# Altium project Servo-Driver-v2.0.PrjPcb (part 5 of 20)

## Sheet Controller-Comms-Sheet-4.SchDoc
size 420 x 297 mm; SheetNumber: 15; SheetTotal: 15
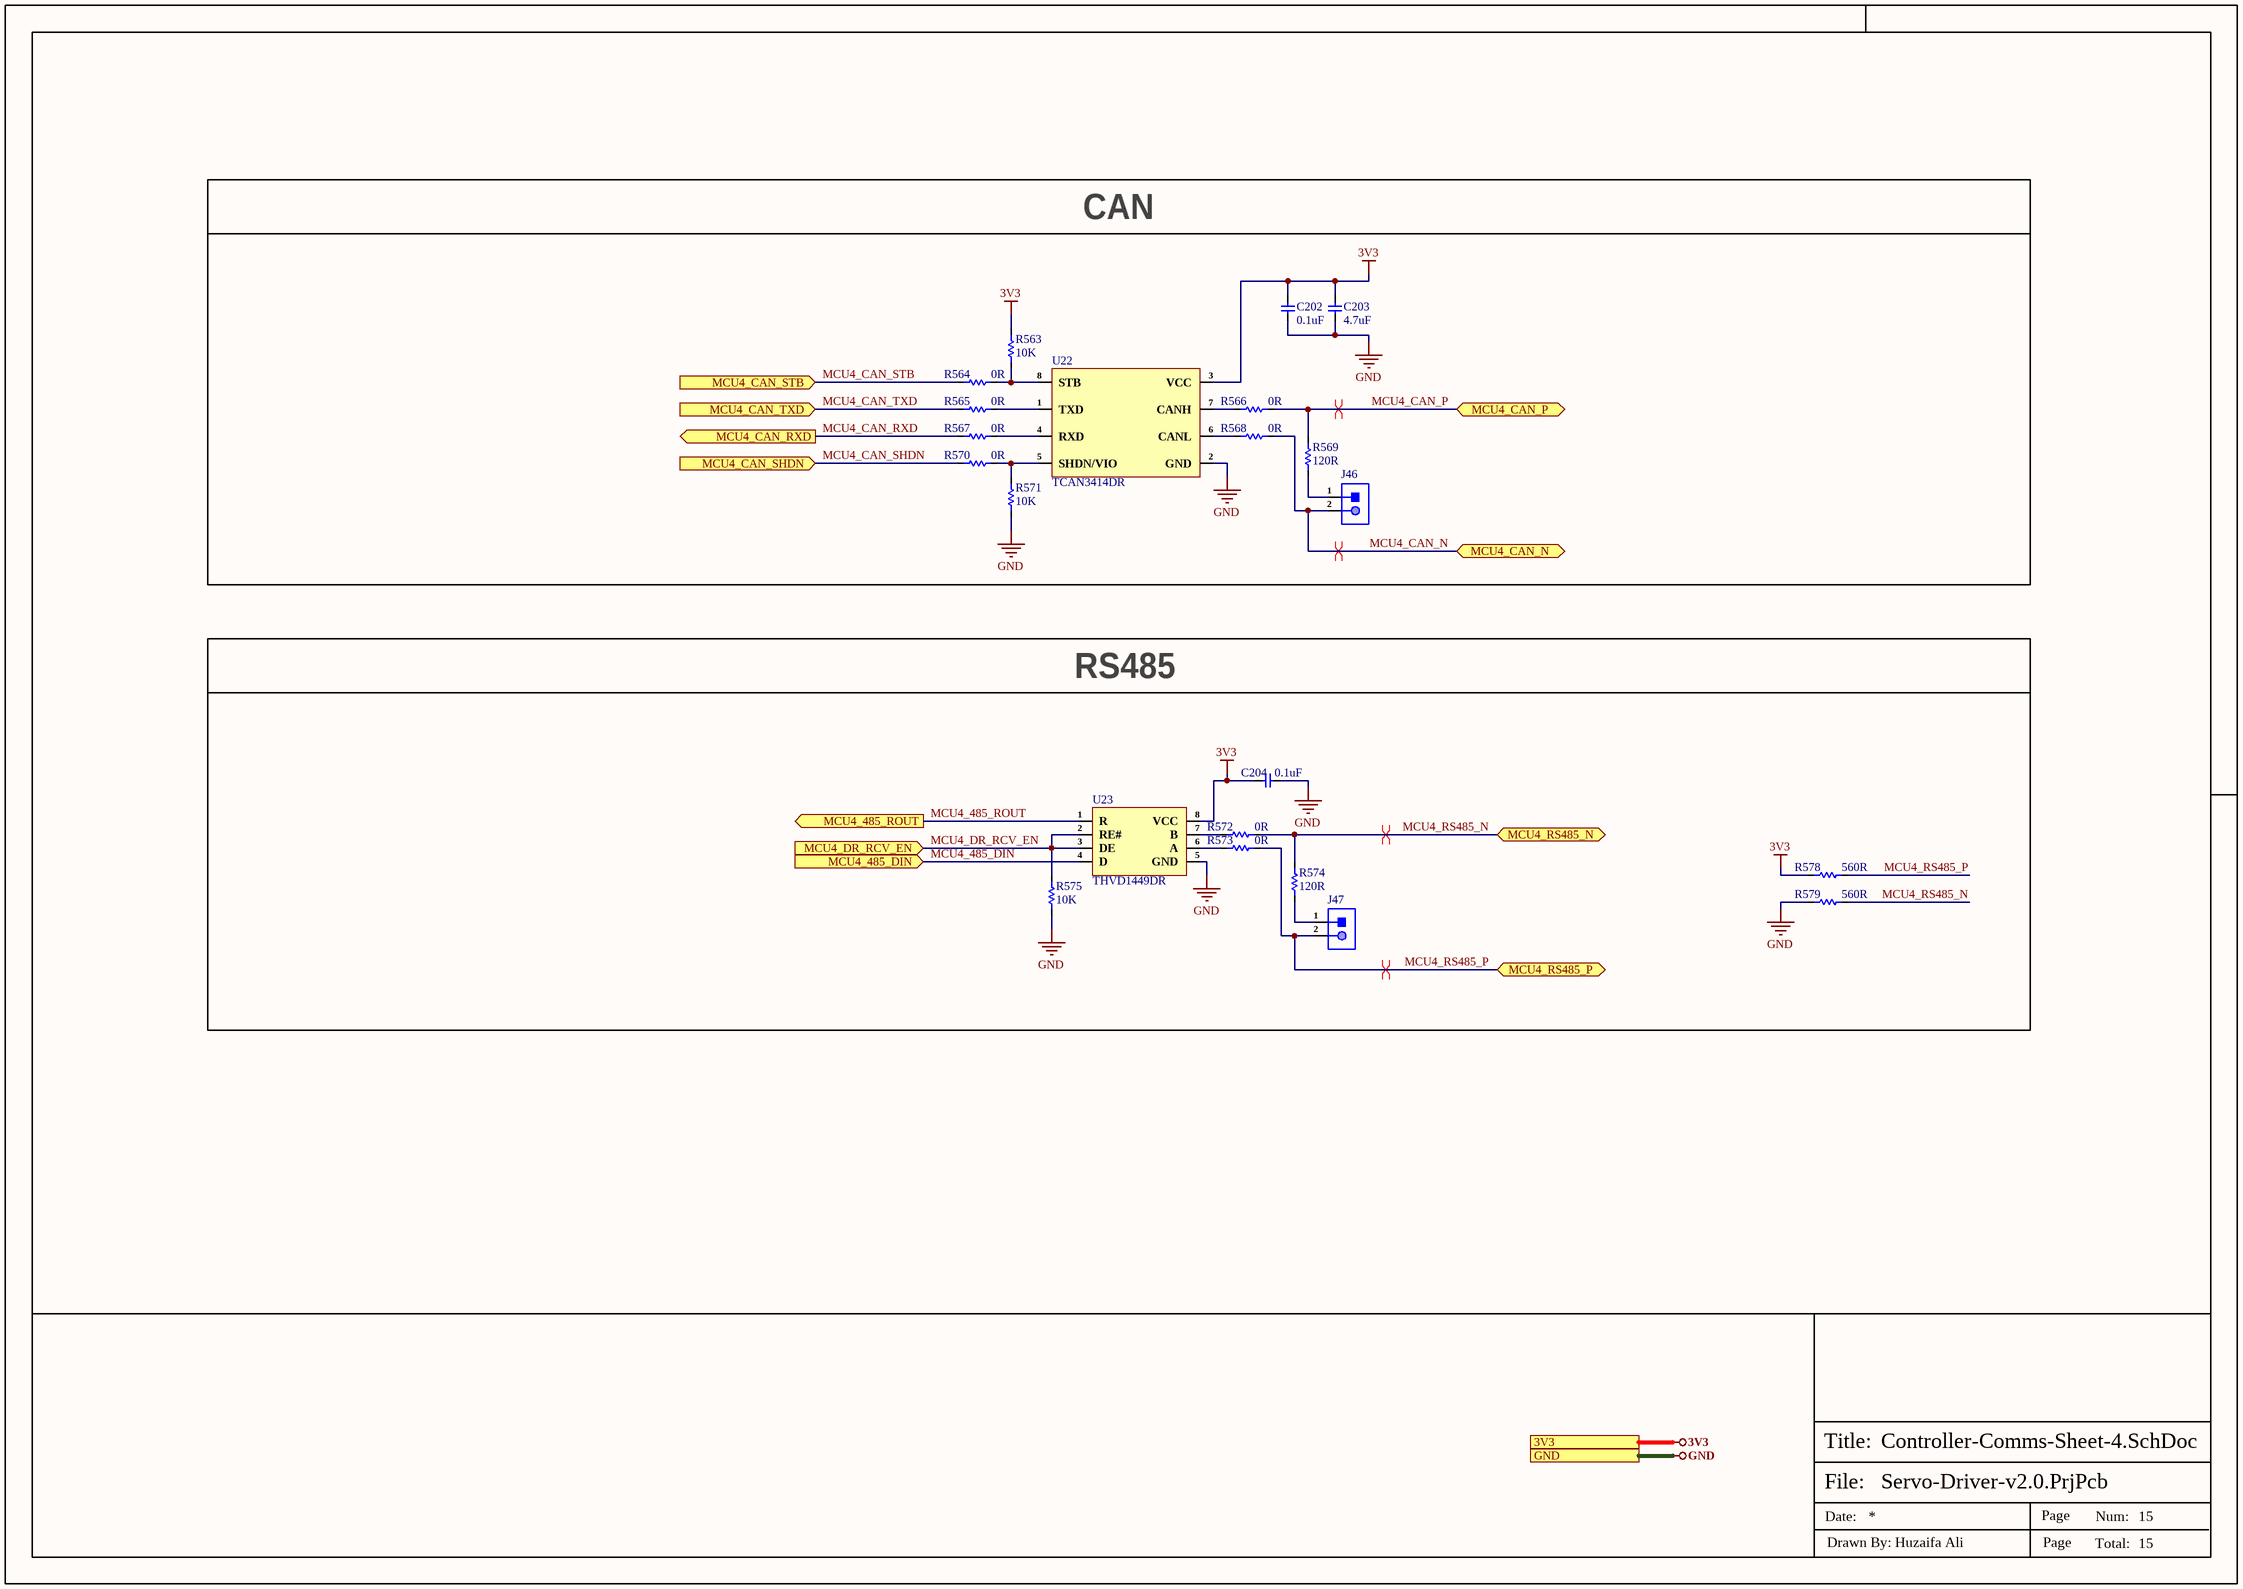
[diagram p4: Controller-Comms-Sheet-4.SchDoc]

### Parts
C202  0.1uF  [Cap-0402]
C203  4.7uF  [Cap-0402]
C204  0.1uF  [Cap-0402]
J46  X6511WV-02H-C60D30  [HDR1X2_]  (value not drawn)
J47  X6511WV-02H-C60D30  [HDR1X2_]  (value not drawn)
R563  10K  [Res-0402]
R564  0R  [Res-0402]
R565  0R  [Res-0402]
R566  0R  [Res-0402]
R567  0R  [Res-0402]
R568  0R  [Res-0402]
R569  120R  [Res-0603]
R570  0R  [Res-0402]
R571  10K  [Res-0402]
R572  0R  [Res-0402]
R573  0R  [Res-0402]
R574  120R  [Res-0603]
R575  10K  [Res-0402]
R578  560R  [Res-0402]
R579  560R  [Res-0402]
U22  TCAN3414DR  [SOIC-8(0.154", 3.90mm Width)]
U23  THVD1449DR  [SOIC-8(0.154", 3.90mm Width)]

### Blocks framed on the sheet
CAN: C202 C203 J46 R563-R571 U22
RS485: C204 J47 R572-R575 R578 R579 U23

### Ports
3V3, GND, MCU4_485_DIN (in), MCU4_485_ROUT (out), MCU4_CAN_N (bidir), MCU4_CAN_P (bidir), MCU4_CAN_RXD (out), MCU4_CAN_SHDN (in), MCU4_CAN_STB (in), MCU4_CAN_TXD (in), MCU4_DR_RCV_EN (in), MCU4_RS485_N (bidir), MCU4_RS485_P (bidir)

### Nets
3V3: C202.2 C203.2 C204.2 R563.2 R578.2 U22.3(VCC) U23.8(VCC) ; port 3V3
GND: C202.1 C203.1 C204.1 R571.1 R575.2 R579.2 U22.2(GND) U23.5(GND) ; port GND
MCU4_485_DIN: U23.4(D) ; port MCU4_485_DIN
MCU4_485_ROUT: U23.1(R) ; port MCU4_485_ROUT
MCU4_CAN_N: J46.2 R568.2 ; port MCU4_CAN_N  [project net CAN_N]
MCU4_CAN_P: R566.2 R569.2 ; port MCU4_CAN_P  [project net CAN_P]
MCU4_CAN_RXD: R567.1 ; port MCU4_CAN_RXD  [project net MCU4_CAN_RX]
MCU4_CAN_SHDN: R570.1 ; port MCU4_CAN_SHDN
MCU4_CAN_STB: R564.1 ; port MCU4_CAN_STB
MCU4_CAN_TXD: R565.1 ; port MCU4_CAN_TXD  [project net MCU4_CAN_TX]
MCU4_DR_RCV_EN: R575.1 U23.2(RE#) U23.3(DE) ; port MCU4_DR_RCV_EN
MCU4_RS485_N: R572.2 R574.2 R579.1 ; port MCU4_RS485_N  [project net MCU1_RS485_N]
MCU4_RS485_P: J47.2 R573.2 R578.1 ; port MCU4_RS485_P  [project net MCU1_RS485_P]
NetJ46_1: J46.1 R569.1
NetJ47_1: J47.1 R574.1
NetR563_1: R563.1 R564.2 U22.8(STB)
NetR565_2: R565.2 U22.1(TXD)
NetR566_1: R566.1 U22.7(CANH)
NetR567_2: R567.2 U22.4(RXD)
NetR568_1: R568.1 U22.6(CANL)
NetR570_2: R570.2 R571.2 U22.5(SHDN/VIO)
NetR572_1: R572.1 U23.7(B)
NetR573_1: R573.1 U23.6(A)

### Layout directives
differential pair; differential pair class DIFF_RS485: MCU1_RS485_N, MCU1_RS485_P
differential pair; differential pair class DIFF_CAN: CAN_N, CAN_P

### Notes on the sheet
- File:
- Title:
- Date:
- Page
- Num:
- Total:
- Drawn By: Huzaifa Ali

### Library data of the parts
C202 C204 = CC0402JRX7R7BB104: as C195 on sheet MOSFET-Motor-Sheet-4; Supplier: Digikey; Supplier Part Number: 311-1676-1-ND; Manufacturer Part Number: CC0402JRX7R7BB104; RoHS: Yes; Category: Ceramic Capacitors; Stock: 1659111; Pricing: 1=0.1, 10=0.046, 50=0.0262, 100=0.0203, 500=0.01528, 1000=0.012, 2500=0.01091, 5000=0.01004 (USD); Mounting Technology: Surface Mount; Case/Package: 0402; Case Code (Metric): 1005; Case Code (Imperial): 0402; Min Operating Temperature: -55°C; Max Operating Temperature: 125°C; Dielectric: X7R; Packaging: Tape and Reel; Package Quantity: 10000; Voltage Rating (DC): 16V; Voltage Rating: 16V; Series: CC; Construction: Flat; Length: 0.039inch; Width: 0.02inch; Height: 0.5mm; Thickness: 0.022inch; Lead Free: Lead Free; Halogen Free: Halogen Free; RoHS Compliant: Yes; ComponentLink1URL: https://datasheet.ciiva.com/13210/upy-gphc-x7r-6-3v-to-50v-8-12304-13210152.pdf?src-supplier=Mouser; ComponentLink1Description: https://datasheet.ciiva.com/13210/upy-gphc-x7r-6-3v-to-50v-8-12304-13210152.pdf?src-supplier=Mouser; LCSC Part Number: C541464
C203 = CC0402KRX5R6BB475: CAP CER 4.7UF 10V X5R 0402; Manufacturer: Yageo; Tolerance: 10%; Supplier 1: Farnell; Manufacturer Part Number: CC0402KRX5R6BB475; RoHS: Yes; Category: Ceramic Capacitors; Stock 1: 20000; Pricing 1: 10000=0.02310, 50000=0.02100 (GBP); Mount: Surface Mount; Case/Package: 0402; Case Code (Imperial): 0402; Case Code (Metric): 1005; Min Operating Temperature: -55°C; Max Operating Temperature: 85°C; Packaging: Cut Tape; Capacitance: 4.7uF; Voltage Rating: 10V; RoHS Compliant: Yes; ComponentLink1URL: http://www.yageo.com/documents/recent/UPY-GPHC_X5R_4V-to-50V_25.pdf?src-supplier=Digi-Key; ComponentLink1Description: http://www.yageo.com/documents/recent/UPY-GPHC_X5R_4V-to-50V_25.pdf?src-supplier=Digi-Key; Supplier Part Number 1: 3871698; LCSC Part Number: C326586
J46 J47 = X6511WV-02H-C60D30: as J43 on sheet MOSFET-Motor-Sheet-4; Manufacturer Part Number: X6511WV-02H-C60D30; Package: Plugin,P=2.54mm; LCSC Part Number: C706874; ComponentLink1Description: LCSC; ComponentLink1URL: https://www.lcsc.com/product-detail/Pin-Headers_XKB-Connectivity-X6511WV-02H-C60D30_C706874.html
R563 R571 R575 = RC0402FR-0710KL: as R551 on sheet MOSFET-Motor-Sheet-4; Supplier 1: Mouser; Manufacturer Part Number: RC0402FR-0710KL; RoHS: Yes; Category: Chip SMD Resistors; Stock 1: 18648329; Pricing 1: 1=0.10000, 10=0.01400, 50=0.01400, 100=0.00500, 1000=0.00300, 10000=0.00200 (USD); Case/Package: 0402; Number of Pins: 2; Case Code (Imperial): 0402; Case Code (Metric): 1005; Min Operating Temperature: -55°C; Max Operating Temperature: 155°C; Resistor Type: Thick Film; Tolerance: 1%; Packaging: Tape and Reel; Voltage Rating: 50V; Termination: SMD/SMT; Working Voltage: 50V; Number of Terminations: 2; Features: Moisture Resistant; Series: RC; Resistance Tolerance: 1%; Construction: Rectangular; Length: 1mm; Width: 0.5mm; Height: 0.32mm; Depth: 0.5mm; Lead Pitch: 0.2mm; REACH SVHC: No SVHC; Lead Free: Lead Free; RoHS Compliant: Yes; Military Standard: Not; ComponentLink1URL: https://datasheet.ciiva.com/7660/38568-7660787.pdf?src-supplier=Element14; ComponentLink1Description: https://datasheet.ciiva.com/7660/38568-7660787.pdf?src-supplier=Element14; ComponentLink2URL: https://datasheet.ciiva.com/7849/1686128-7849814.pdf?src-supplier=Element14; ComponentLink2Description: https://datasheet.ciiva.com/7849/1686128-7849814.pdf?src-supplier=Element14; ComponentLink3URL: https://datasheet.ciiva.com/7983/1018594-7983486.pdf?src-supplier=Element14; ComponentLink3Description: https://datasheet.ciiva.com/7983/1018594-7983486.pdf?src-supplier=Element14; ComponentLink4URL: https://datasheet.ciiva.com/22747/1018594-22747512.pdf?src-supplier=Element14; ComponentLink4Description: https://datasheet.ciiva.com/22747/1018594-22747512.pdf?src-supplier=Element14; ComponentLink5URL: https://datasheet.ciiva.com/12667/pyu-rc0402-51-rohs-l-6-r-12667067.pdf?src-supplier=Mouser; ComponentLink5Description: https://datasheet.ciiva.com/12667/pyu-rc0402-51-rohs-l-6-r-12667067.pdf?src-supplier=Mouser; ComponentLink6URL: https://datasheet.ciiva.com/7849/1784430-7849813.pdf?src-supplier=Element14; ComponentLink6Description: https://datasheet.ciiva.com/7849/1784430-7849813.pdf?src-supplier=Element14; ComponentLink7URL: https://datasheet.ciiva.com/7849/1784430-7849815.pdf?src-supplier=Element14; ComponentLink7Description: https://datasheet.ciiva.com/7849/1784430-7849815.pdf?src-supplier=Element14; Supplier Part Number 1: 603-RC0402FR-0710KL; LCSC Part Number: C60490
R564-R568 R570 R572 R573 = RC0402FR-070RL: as R548 on sheet MOSFET-Motor-Sheet-4; Supplier 1: Mouser; Manufacturer Part Number: RC0402FR-070RL; RoHS: Yes; Stock 1: 8556842; Pricing 1: 1=0.10000, 10=0.01400, 50=0.01400, 100=0.00600, 1000=0.00300, 5000=0.00200, 10000=0.00100 (USD); Mount: Surface Mount; Case/Package: 0402; Contact Plating: Tin,Matte; Case Code (Imperial): 0402; Case Code (Metric): 1005; Size Code: 0402; Min Operating Temperature: -55°C; Max Operating Temperature: 155°C; Resistance: 0R; Resistor Type: Thick Film; Packaging: Tape and Reel; Termination: SMD/SMT; Features: Moisture Resistant; Series: RC; Number of Terminations: 2; Length: 1mm; Width: 0.5mm; Height: 0.35mm; Radiation Hardening: No; Lead Free: Lead Free; RoHS Compliant: Yes; ComponentLink1URL: https://datasheet.ciiva.com/8896/pyu-rc0402-51-rohs-l-6-8896149.pdf?src-supplier=Avnet; ComponentLink1Description: https://datasheet.ciiva.com/8896/pyu-rc0402-51-rohs-l-6-8896149.pdf?src-supplier=Avnet; ComponentLink2URL: https://datasheet.ciiva.com/16790/pyu-rc0402-51-rohs-l-6-r-16790444.pdf?src-supplier=Future+Electronics; ComponentLink2Description: https://datasheet.ciiva.com/16790/pyu-rc0402-51-rohs-l-6-r-16790444.pdf?src-supplier=Future+Electronics; Supplier Part Number 1: 603-RC0402FR-070RL; LCSC Part Number: C106231
R569 R574 = RC0603FR-07120RL: as R550 on sheet MOSFET-Motor-Sheet-4; Supplier 1: Digi-Key; Manufacturer Part Number: RC0603FR-07120RL; RoHS: Yes; Category: Chip SMD Resistors; Stock 1: 839061; Pricing 1: 1=0.10000, 10=0.02400, 100=0.00970, 1000=0.00436, 2500=0.00378 (USD); Case/Package: 0603; Number of Pins: 2; Case Code (Metric): 1608; Case Code (Imperial): 0603; Size Code: 0603; Min Operating Temperature: -55°C; Max Operating Temperature: 155°C; Resistance: 120R; Tolerance: 1%; Resistor Type: Thick Film; Packaging: Tape and Reel; Voltage Rating: 50V; Package Quantity: 1; Number of Terminations: 2; Termination: SMD/SMT; Max Power Dissipation: 100mW; Features: Moisture Resistant; Series: RC; Construction: Rectangular; Resistance Tolerance: 1%; Length: 1.6mm; Width: 0.031inch; Height: 0.022inch; Depth: 0.8mm; REACH SVHC: No SVHC; Lead Free: Lead Free; Military Standard: Not; RoHS Compliant: Yes; ComponentLink1URL: https://datasheet.ciiva.com/2553/pyu-r-int-thick-7-2553512.pdf?src-supplier=Digi-Key; ComponentLink1Description: https://datasheet.ciiva.com/2553/pyu-r-int-thick-7-2553512.pdf?src-supplier=Digi-Key; ComponentLink2URL: https://datasheet.ciiva.com/7746/443971-7746248.pdf?src-supplier=Element14; ComponentLink2Description: https://datasheet.ciiva.com/7746/443971-7746248.pdf?src-supplier=Element14; ComponentLink3URL: https://datasheet.ciiva.com/2553/pyu-r-int-thick-7-2553513.pdf?src-supplier=Digi-Key; ComponentLink3Description: https://datasheet.ciiva.com/2553/pyu-r-int-thick-7-2553513.pdf?src-supplier=Digi-Key; ComponentLink4URL: https://datasheet.ciiva.com/7746/443971-7746249.pdf?src-supplier=Element14; ComponentLink4Description: https://datasheet.ciiva.com/7746/443971-7746249.pdf?src-supplier=Element14; ComponentLink5URL: https://datasheet.ciiva.com/2553/pyu-r-int-thick-7-2553514.pdf?src-supplier=Digi-Key; ComponentLink5Description: https://datasheet.ciiva.com/2553/pyu-r-int-thick-7-2553514.pdf?src-supplier=Digi-Key; ComponentLink6URL: https://datasheet.ciiva.com/46395/443971-46395021.pdf?src-supplier=Element14; ComponentLink6Description: https://datasheet.ciiva.com/46395/443971-46395021.pdf?src-supplier=Element14; Supplier Part Number 1: 311-120HRCT-ND; LCSC Part Number: C114640
R578 R579 = RC0402FR-07560RL: RES 560 OHM 1% 1/16W 0402; Manufacturer: Yageo; Power Rating: 63mW; Temperature Coefficient: 100ppm/°C; Voltage Rating: 50V; Item Type: Resistor; Supplier: Future Electronics; Supplier Part Number: 8872046; Manufacturer Part Number: RC0402FR-07560RL; RoHS: Yes; Category: Chip SMD Resistors; Stock: 1360000; Pricing: 10000=0.0012, 100000=0.0011, 300000=0.0011, 1250000=0.001, 3000000=0.0009 (USD); Case/Package: 0402; Case Code (Metric): 1005; Case Code (Imperial): 0402; Min Operating Temperature: -55°C; Max Operating Temperature: 155°C; Tolerance: 1%; Packaging: Tape and Reel; Value: 560R; Package Quantity: 1; Resistor Type: Thick Film; Number of Terminations: 2; Termination: SMD/SMT; Max Power Dissipation: 63mW; Features: Moisture Resistant; Series: RC; Construction: Rectangular; Resistance Tolerance: 1%; Length: 1mm; Width: 0.02inch; Height: 0.016inch; Depth: 0.5mm; RoHS Compliant: Yes; Military Standard: Not; Lead Free: Lead Free; Reach SVHC Compliant: Unknown; ComponentLink1URL: https://datasheet.ciiva.com/2453/pyu-r-int-thick-7-2453458.pdf?src-supplier=Digikey; ComponentLink1Description: https://datasheet.ciiva.com/2453/pyu-r-int-thick-7-2453458.pdf?src-supplier=Digikey; ComponentLink2URL: https://datasheet.ciiva.com/2453/pyu-r-int-thick-7-2453459.pdf?src-supplier=Digikey; ComponentLink2Description: https://datasheet.ciiva.com/2453/pyu-r-int-thick-7-2453459.pdf?src-supplier=Digikey; ComponentLink3URL: https://datasheet.ciiva.com/2453/pyu-r-int-thick-7-2453457.pdf?src-supplier=Digikey; ComponentLink3Description: https://datasheet.ciiva.com/2453/pyu-r-int-thick-7-2453457.pdf?src-supplier=Digikey; ComponentLink4URL: https://datasheet.ciiva.com/12558/pyu-rc0402-51-rohs-l-6-r-8721-12558383.pdf?src-supplier=Mouser; ComponentLink4Description: https://datasheet.ciiva.com/12558/pyu-rc0402-51-rohs-l-6-r-8721-12558383.pdf?src-supplier=Mouser; ComponentLink5URL: https://datasheet.ciiva.com/7850/1018594-7850042.pdf?src-supplier=Element14; ComponentLink5Description: https://datasheet.ciiva.com/7850/1018594-7850042.pdf?src-supplier=Element14; ComponentLink6URL: https://datasheet.ciiva.com/7850/1018594-7850043.pdf?src-supplier=Element14; ComponentLink6Description: https://datasheet.ciiva.com/7850/1018594-7850043.pdf?src-supplier=Element14; LCSC Part Number: C163460
U22 = TCAN3414DR: IC TRANSCEIVER HALF 1/1 8SOIC; Manufacturer: Texas Instruments; Supplier: Mouser; LCSC Part Number: C22396693; Manufacturer Part Number: TCAN3414DR; RoHS: No; Item Type: IC; Stock: 201; Pricing: 1=1.55, 10=1.1, 50=1.1, 100=0.895, 1000=0.763, 10000=0.681 (USD); Case/Package: SOIC; Pins: 8; Length: 4.9mm; Width: 3.91mm; Height: 1.75mm; Thickness: 1.58mm
U23 = THVD1449DR: as U21 on sheet MOSFET-Motor-Sheet-4; Supplier: Mouser; LCSC Part Number: C3235059; Manufacturer Part Number: THVD1449DR; RoHS: No; Item Type: IC; Stock: 7454; Pricing: 1=3.62, 10=2.51, 50=2.51, 100=2.27, 1000=2.02, 10000=1.95 (USD)

## Sheet Controller-Driver-Sheet-3.SchDoc
size 420 x 297 mm; SheetNumber: 10; SheetTotal: 15
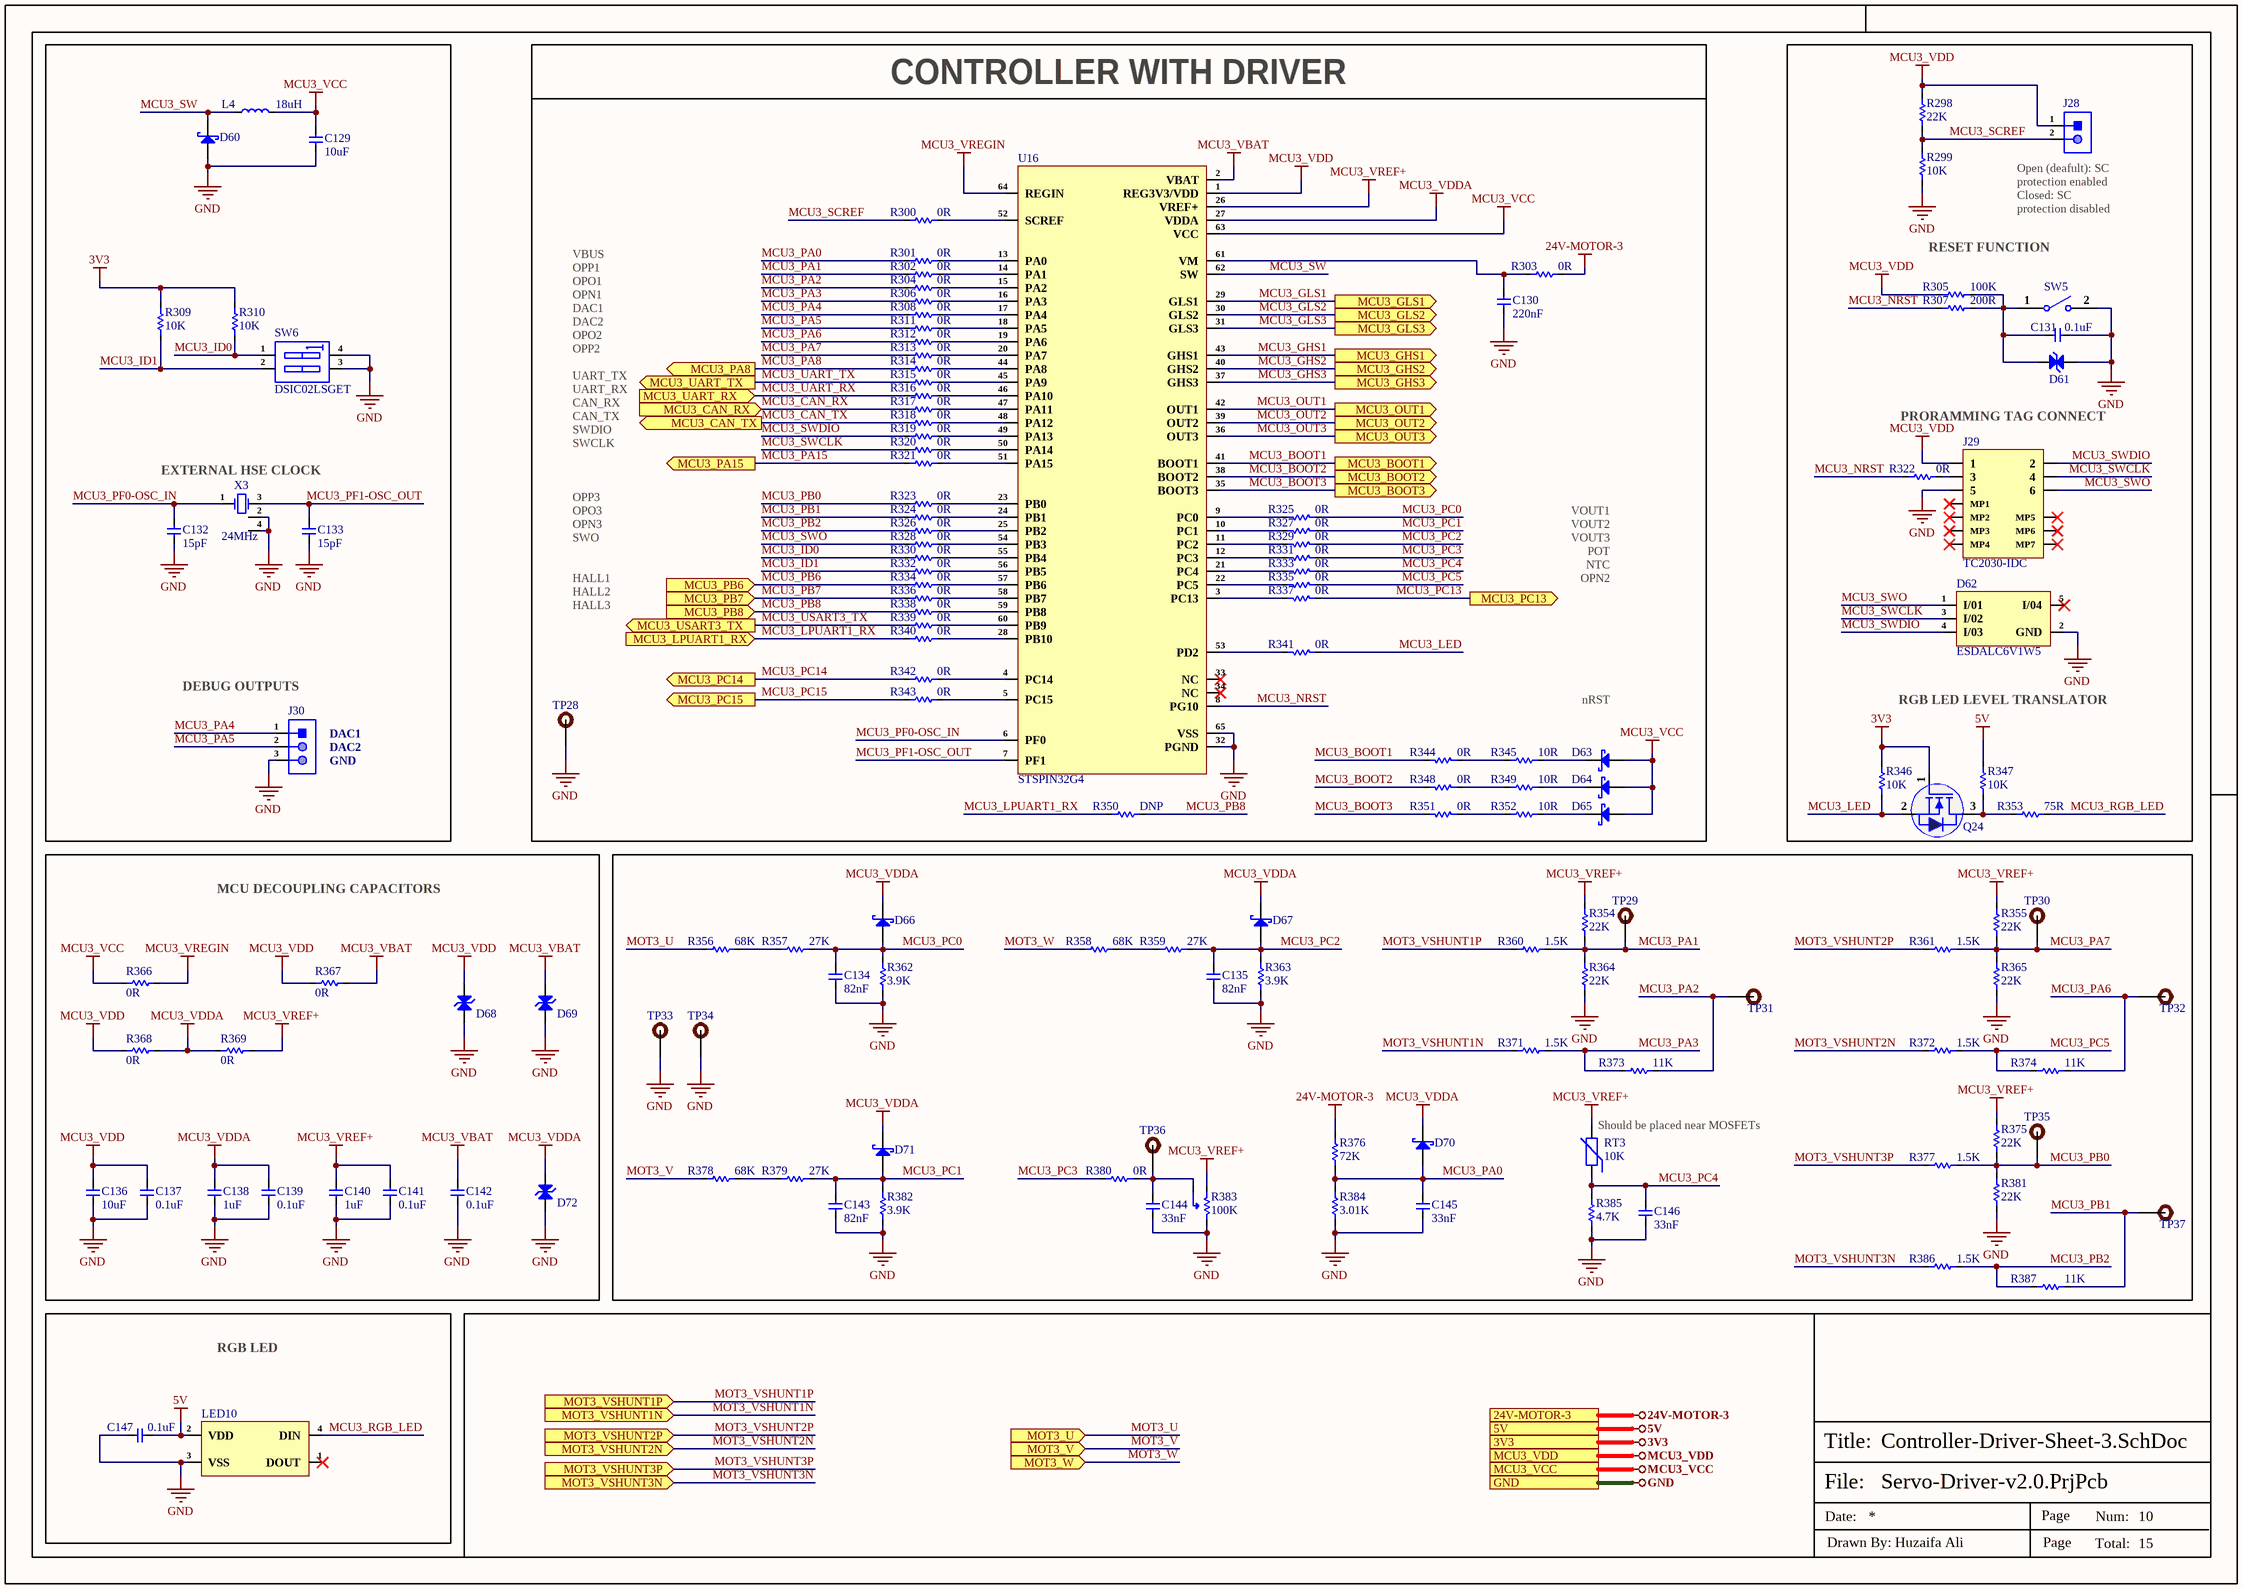
[diagram p5: Controller-Driver-Sheet-3.SchDoc]

### Parts
C129  10uF  [Cap-0805]
C130  220nF  [Cap-0805]
C131  0.1uF  [Cap-0402]
C132  15pF  [Cap-0201]
C133  15pF  [Cap-0201]
C134  82nF  [Cap-0603]
C135  82nF  [Cap-0603]
C136  10uF  [Cap-0603]
C137  0.1uF  [Cap-0402]
C138  1uF  [Cap-0402]
C139  0.1uF  [Cap-0402]
C140  1uF  [Cap-0402]
C141  0.1uF  [Cap-0402]
C142  0.1uF  [Cap-0402]
C143  82nF  [Cap-0603]
C144  33nF  [Cap-0603]
C145  33nF  [Cap-0603]
C146  33nF  [Cap-0603]
C147  0.1uF  [Cap-0402]
D60  STPS1H100A  [SMA]  (value not drawn)
D61  ESDM2033MX4T5G  [DFN-2(0.3x0.6)]  (value not drawn)
D62  ESDALC6V1W5  [SOT-323-5]
D63  BAT46ZFILM  [SOD-123]  (value not drawn)
D64  BAT46ZFILM  [SOD-123]  (value not drawn)
D65  BAT46ZFILM  [SOD-123]  (value not drawn)
D66  BAT30KFILM  [SOD-523]  (value not drawn)
D67  BAT30KFILM  [SOD-523]  (value not drawn)
D68  ESDM2033MX4T5G  [DFN-2(0.3x0.6)]  (value not drawn)
D69  ESDM2033MX4T5G  [DFN-2(0.3x0.6)]  (value not drawn)
D70  BAT30KFILM  [SOD-523]  (value not drawn)
D71  BAT30KFILM  [SOD-523]  (value not drawn)
D72  ESDM2033MX4T5G  [DFN-2(0.3x0.6)]  (value not drawn)
J28  X6511WV-02H-C60D30  [HDR1X2_]  (value not drawn)
J29  TC2030-IDC  [TC2030-IDC_]
J30  X6511WV-03H-C60D30  [HDR1X3_]  (value not drawn)
L4  18uH  [FNR5040S180MT]
LED10  WS2812D-F5  [WS2812D-F5]  (value not drawn)
Q24  Si2302CDS  [Sot-23]  (value not drawn)
R298  22K  [Res-0402]
R299  10K  [Res-0402]
R300  0R  [Res-0402]
R301  0R  [Res-0402]
R302  0R  [Res-0402]
R303  0R  [Res-0805]
R304  0R  [Res-0402]
R305  100K  [Res-0402]
R306  0R  [Res-0402]
R307  200R  [Res-0402]
R308  0R  [Res-0402]
R309  10K  [Res-0402]
R310  10K  [Res-0402]
R311  0R  [Res-0402]
R312  0R  [Res-0402]
R313  0R  [Res-0402]
R314  0R  [Res-0402]
R315  0R  [Res-0402]
R316  0R  [Res-0402]
R317  0R  [Res-0402]
R318  0R  [Res-0402]
R319  0R  [Res-0402]
R320  0R  [Res-0402]
R321  0R  [Res-0402]
R322  0R  [Res-0402]
R323  0R  [Res-0402]
R324  0R  [Res-0402]
R325  0R  [Res-0402]
R326  0R  [Res-0402]
R327  0R  [Res-0402]
R328  0R  [Res-0402]
R329  0R  [Res-0402]
R330  0R  [Res-0402]
R331  0R  [Res-0402]
R332  0R  [Res-0402]
R333  0R  [Res-0402]
R334  0R  [Res-0402]
R335  0R  [Res-0402]
R336  0R  [Res-0402]
R337  0R  [Res-0402]
R338  0R  [Res-0402]
R339  0R  [Res-0402]
R340  0R  [Res-0402]
R341  0R  [Res-0402]
R342  0R  [Res-0402]
R343  0R  [Res-0402]
R344  0R  [Res-0402]
R345  10R  [Res-0603]
R346  10K  [Res-0402]
R347  10K  [Res-0402]
R348  0R  [Res-0402]
R349  10R  [Res-0603]
R350  DNP  [Res-0402]
R351  0R  [Res-0402]
R352  10R  [Res-0603]
R353  75R  [Res-0402]
R354  22K  [Res-0402]
R355  22K  [Res-0402]
R356  68K  [Res-0603]
R357  27K  [Res-0603]
R358  68K  [Res-0603]
R359  27K  [Res-0603]
R360  1.5K  [Res-0402]
R361  1.5K  [Res-0402]
R362  3.9K  [Res-0603]
R363  3.9K  [Res-0603]
R364  22K  [Res-0402]
R365  22K  [Res-0402]
R366  0R  [Res-0805]
R367  0R  [Res-0805]
R368  0R  [Res-0805]
R369  0R  [Res-0805]
R371  1.5K  [Res-0402]
R372  1.5K  [Res-0402]
R373  11K  [Res-0402]
R374  11K  [Res-0402]
R375  22K  [Res-0402]
R376  72K  [Res-0603]
R377  1.5K  [Res-0402]
R378  68K  [Res-0603]
R379  27K  [Res-0603]
R380  0R  [Res-0805]
R381  22K  [Res-0402]
R382  3.9K  [Res-0603]
R383  100K  [3386P-1-104TLF]
R384  3.01K  [Res-0603]
R385  4.7K  [Res-0402]
R386  1.5K  [Res-0402]
R387  11K  [Res-0402]
RT3  10K  [Res-0603]
SW5  B3U-1000P  [B3U-1000P]  (value not drawn)
SW6  DSIC02LSGET  [DSIC02LSGET]
TP28  TEST POINT  [Test-point]  (value not drawn)  (no BOM)
TP29  TEST POINT  [Test-point]  (value not drawn)  (no BOM)
TP30  TEST POINT  [Test-point]  (value not drawn)  (no BOM)
TP31  TEST POINT  [Test-point]  (value not drawn)  (no BOM)
TP32  TEST POINT  [Test-point]  (value not drawn)  (no BOM)
TP33  TEST POINT  [Test-point]  (value not drawn)  (no BOM)
TP34  TEST POINT  [Test-point]  (value not drawn)  (no BOM)
TP35  TEST POINT  [Test-point]  (value not drawn)  (no BOM)
TP36  TEST POINT  [Test-point]  (value not drawn)  (no BOM)
TP37  TEST POINT  [Test-point]  (value not drawn)  (no BOM)
U16  STSPIN32G4  [64-VFQFPN 9X9]
X3  24MHz  [SMD2016-4P]

### Blocks framed on the sheet
CONTROLLER WITH DRIVER: C130 D63-D65 R300-R304 R306 R308 R311-R321 R323-R345 R348-R352 TP28 U16
MCU DECOUPLING CAPACITORS: C136-C142 D68 D69 D72 R366-R369
Should be placed near MOSFETs: C134 C135 C143-C146 D66 D67 D70 D71 R354-R365 R371-R387 RT3 TP29-TP37
RGB LED: C147 LED10

### Ports
3V3, 5V, 24V-MOTOR-3, GND, MCU3_BOOT1 (out), MCU3_BOOT2 (out), MCU3_BOOT3 (out), MCU3_CAN_RX (in), MCU3_CAN_TX (out), MCU3_GHS1 (out), MCU3_GHS2 (out), MCU3_GHS3 (out), MCU3_GLS1 (out), MCU3_GLS2 (out), MCU3_GLS3 (out), MCU3_LPUART1_RX (in), MCU3_OUT1 (out), MCU3_OUT2 (out), MCU3_OUT3 (out), MCU3_PA8 (out), MCU3_PA15 (out), MCU3_PB6 (in), MCU3_PB7 (in), MCU3_PB8 (in), MCU3_PC13 (out), MCU3_PC14 (out), MCU3_PC15 (out), MCU3_UART_RX (in), MCU3_UART_TX (out), MCU3_USART3_TX (out), MCU3_VCC, MCU3_VDD, MOT3_U (in), MOT3_V (in), MOT3_VSHUNT1N (in), MOT3_VSHUNT1P (in), MOT3_VSHUNT2N (in), MOT3_VSHUNT2P (in), MOT3_VSHUNT3N (in), MOT3_VSHUNT3P (in), MOT3_W (in)

### Nets
3V3: Q24.1(G) R309.2 R310.2 R346.2 ; port 3V3
5V: C147.2 LED10.2(VDD) R347.2 ; port 5V
24V-MOTOR-3: R303.2 R376.2 ; port 24V-MOTOR-3
GND: C129.1 C130.1 C131.1 C132.1 C133.1 C134.1 C135.1 C136.1 C137.1 C138.1 C139.1 C140.1 C141.1 C142.1 C143.1 C144.1 C145.1 C146.1 C147.1 D60.2(A) D61.1(A) D62.2(GND) D68.1(A) D69.1(A) D72.1(A) J29.5 J30.3 LED10.3(VSS) R299.1 R362.1 R363.1 R364.1 R365.1 R381.1 R382.1 R383.3(CW) R384.1 R385.1 SW5.2 SW6.3(A3) SW6.4(B3) TP28.1 TP33.1 TP34.1 U16.32(PGND) U16.65(VSS) X3.2(GND) X3.4(GND) ; port GND
MCU3_VBAT: C142.2 D69.2(A) R367.2 U16.2(VBAT)
MCU3_VCC: C129.2 D63.1(A) D64.1(A) D65.1(A) L4.2 R366.1 U16.63(VCC) ; port MCU3_VCC
MCU3_VDD: C136.2 C137.2 D68.2(A) J28.1 J29.1 R298.2 R305.1 R367.1 R368.1 U16.1(REG3V3/VDD) ; port MCU3_VDD
MCU3_VDDA: C138.2 C139.2 D66.2(K) D67.2(K) D70.2(K) D71.2(K) D72.2(A) R368.2 R369.1 U16.27(VDDA)
MCU3_VREF+: C140.2 C141.2 R354.2 R355.2 R369.2 R375.2 R383.1(CCW) RT3.2 U16.26(VREF+)
MCU3_VREGIN: R366.2 U16.64(REGIN)
MCU3_BOOT1: R344.1 U16.41(BOOT1) ; port MCU3_BOOT1
MCU3_BOOT2: R348.1 U16.38(BOOT2) ; port MCU3_BOOT2
MCU3_BOOT3: R351.1 U16.35(BOOT3) ; port MCU3_BOOT3
MCU3_CAN_RX: R317.2 ; port MCU3_CAN_RX
MCU3_CAN_TX: R318.2 ; port MCU3_CAN_TX
MCU3_GHS1: U16.43(GHS1) ; port MCU3_GHS1
MCU3_GHS2: U16.40(GHS2) ; port MCU3_GHS2
MCU3_GHS3: U16.37(GHS3) ; port MCU3_GHS3
MCU3_GLS1: U16.29(GLS1) ; port MCU3_GLS1
MCU3_GLS2: U16.30(GLS2) ; port MCU3_GLS2
MCU3_GLS3: U16.31(GLS3) ; port MCU3_GLS3
MCU3_ID0: R310.1 R330.2 SW6.1(A1)
MCU3_ID1: R309.1 R332.2 SW6.2(A2)
MCU3_LED: Q24.2(S) R341.2 R346.1
MCU3_LPUART1_RX: R340.2 R350.2 ; port MCU3_LPUART1_RX  [project net MCU3_485_ROUT]
MCU3_NRST: R307.1 R322.2 U16.8(PG10)
MCU3_OUT1: U16.42(OUT1) ; port MCU3_OUT1
MCU3_OUT2: U16.39(OUT2) ; port MCU3_OUT2
MCU3_OUT3: U16.36(OUT3) ; port MCU3_OUT3
MCU3_PA0: C145.2 D70.1(A) R301.2 R376.1 R384.2
MCU3_PA1: R302.2 R354.1 R360.2 R364.2 TP29.1
MCU3_PA2: R304.2 R373.2 TP31.1
MCU3_PA3: R306.2 R371.2 R373.1
MCU3_PA4: J30.1 R308.2
MCU3_PA5: J30.2 R311.2
MCU3_PA6: R312.2 R374.2 TP32.1
MCU3_PA7: R313.2 R355.1 R361.2 R365.2 TP30.1
MCU3_PA8: R314.2 ; port MCU3_PA8
MCU3_PA15: R321.2 ; port MCU3_PA15
MCU3_PB0: R323.2 R375.1 R377.2 R381.2 TP35.1
MCU3_PB1: R324.2 R387.2 TP37.1
MCU3_PB2: R326.2 R386.2 R387.1
MCU3_PB6: R334.2 ; port MCU3_PB6  [project net MCU3_HALL1]
MCU3_PB7: R336.2 ; port MCU3_PB7  [project net MCU3_HALL2]
MCU3_PB8: R338.2 R350.1 ; port MCU3_PB8  [project net MCU3_HALL3]
MCU3_PC0: C134.2 D66.1(A) R325.2 R357.2 R362.2
MCU3_PC1: C143.2 D71.1(A) R327.2 R379.2 R382.2
MCU3_PC2: C135.2 D67.1(A) R329.2 R359.2 R363.2
MCU3_PC3: R331.2 R380.1
MCU3_PC4: C146.2 R333.2 R385.2 RT3.1
MCU3_PC5: R335.2 R372.2 R374.1
MCU3_PC13: R337.2 ; port MCU3_PC13  [project net MCU3_DR_RCV_EN]
MCU3_PC14: R342.2 ; port MCU3_PC14  [project net MCU3_CAN_SHDN]
MCU3_PC15: R343.2 ; port MCU3_PC15  [project net MCU3_CAN_STB]
MCU3_PF0-OSC_IN: C132.2 U16.6(PF0) X3.1(OSC1)
MCU3_PF1-OSC_OUT: C133.2 U16.7(PF1) X3.3(OSC2)
MCU3_RGB_LED: LED10.4(DIN) R353.2
MCU3_SCREF: J28.2 R298.1 R299.2 R300.2
MCU3_SW: D60.1(K) L4.1 U16.62(SW)
MCU3_SWCLK: D62.3(I/02) J29.4 R320.2
MCU3_SWDIO: D62.4(I/03) J29.2 R319.2
MCU3_SWO: D62.1(I/01) J29.6 R328.2
MCU3_UART_RX: R316.2 ; port MCU3_UART_RX
MCU3_UART_TX: R315.2 ; port MCU3_UART_TX
MCU3_USART3_TX: R339.2 ; port MCU3_USART3_TX  [project net MCU3_485_DIN]
MOT3_U: R356.1 ; port MOT3_U
MOT3_V: R378.1 ; port MOT3_V
MOT3_VSHUNT1N: R371.1 ; port MOT3_VSHUNT1N
MOT3_VSHUNT1P: R360.1 ; port MOT3_VSHUNT1P
MOT3_VSHUNT2N: R372.1 ; port MOT3_VSHUNT2N
MOT3_VSHUNT2P: R361.1 ; port MOT3_VSHUNT2P
MOT3_VSHUNT3N: R386.1 ; port MOT3_VSHUNT3N
MOT3_VSHUNT3P: R377.1 ; port MOT3_VSHUNT3P
MOT3_W: R358.1 ; port MOT3_W
NetC130_2: C130.2 R303.1 U16.61(VM)
NetC131_2: C131.2 D61.2(A) R305.2 R307.2 SW5.1
NetC144_2: C144.2 R380.2 R383.2(Wiper) TP36.1
NetD63_2: D63.2(K) R345.2
NetD64_2: D64.2(K) R349.2
NetD65_2: D65.2(K) R352.2
NetJ29_3: J29.3 R322.1
NetQ24_3: Q24.3(D) R347.1 R353.1
NetR300_1: R300.1 U16.52(SCREF)
NetR301_1: R301.1 U16.13(PA0)
NetR302_1: R302.1 U16.14(PA1)
NetR304_1: R304.1 U16.15(PA2)
NetR306_1: R306.1 U16.16(PA3)
NetR308_1: R308.1 U16.17(PA4)
NetR311_1: R311.1 U16.18(PA5)
NetR312_1: R312.1 U16.19(PA6)
NetR313_1: R313.1 U16.20(PA7)
NetR314_1: R314.1 U16.44(PA8)
NetR315_1: R315.1 U16.45(PA9)
NetR316_1: R316.1 U16.46(PA10)
NetR317_1: R317.1 U16.47(PA11)
NetR318_1: R318.1 U16.48(PA12)
NetR319_1: R319.1 U16.49(PA13)
NetR320_1: R320.1 U16.50(PA14)
NetR321_1: R321.1 U16.51(PA15)
NetR323_1: R323.1 U16.23(PB0)
NetR324_1: R324.1 U16.24(PB1)
NetR325_1: R325.1 U16.9(PC0)
NetR326_1: R326.1 U16.25(PB2)
NetR327_1: R327.1 U16.10(PC1)
NetR328_1: R328.1 U16.54(PB3)
NetR329_1: R329.1 U16.11(PC2)
NetR330_1: R330.1 U16.55(PB4)
NetR331_1: R331.1 U16.12(PC3)
NetR332_1: R332.1 U16.56(PB5)
NetR333_1: R333.1 U16.21(PC4)
NetR334_1: R334.1 U16.57(PB6)
NetR335_1: R335.1 U16.22(PC5)
NetR336_1: R336.1 U16.58(PB7)
NetR337_1: R337.1 U16.3(PC13)
NetR338_1: R338.1 U16.59(PB8)
NetR339_1: R339.1 U16.60(PB9)
NetR340_1: R340.1 U16.28(PB10)
NetR341_1: R341.1 U16.53(PD2)
NetR342_1: R342.1 U16.4(PC14)
NetR343_1: R343.1 U16.5(PC15)
NetR344_2: R344.2 R345.1
NetR348_2: R348.2 R349.1
NetR351_2: R351.2 R352.1
NetR356_2: R356.2 R357.1
NetR358_2: R358.2 R359.1
NetR378_2: R378.2 R379.1

Not connected (* = marked no-connect by the designer): D62 5(I/04)*; J29 MP1* MP2* MP3* MP4* MP5* MP6* MP7*; LED10 1(DOUT)*; U16 33(NC)* 34(NC)*

### Notes on the sheet
- VBUS
- OPP1
- RESET FUNCTION
- (near J28) Open (deafult): SC protection enabled
  Closed: SC protection disabled
- OPO1
- OPN1
- DAC1
- DAC2
- OPO2
- OPP2
- UART_TX
- UART_RX
- CAN_RX
- CAN_TX
- SWDIO
- SWCLK
- PRORAMMING TAG CONNECT
- (near X3) EXTERNAL HSE CLOCK
- OPP3
- OPO3
- OPN3
- SWO
- VOUT1
- VOUT2
- VOUT3
- HALL1
- HALL2
- POT
- NTC
- OPN2
- HALL3
- (near J30) DEBUG OUTPUTS
- (near J30) DAC1
- nRST
- RGB LED LEVEL TRANSLATOR
- (near J30) DAC2
- (near J30) GND
- File:
- Title:
- Date:
- Page
- Num:
- Total:
- Drawn By: Huzaifa Ali